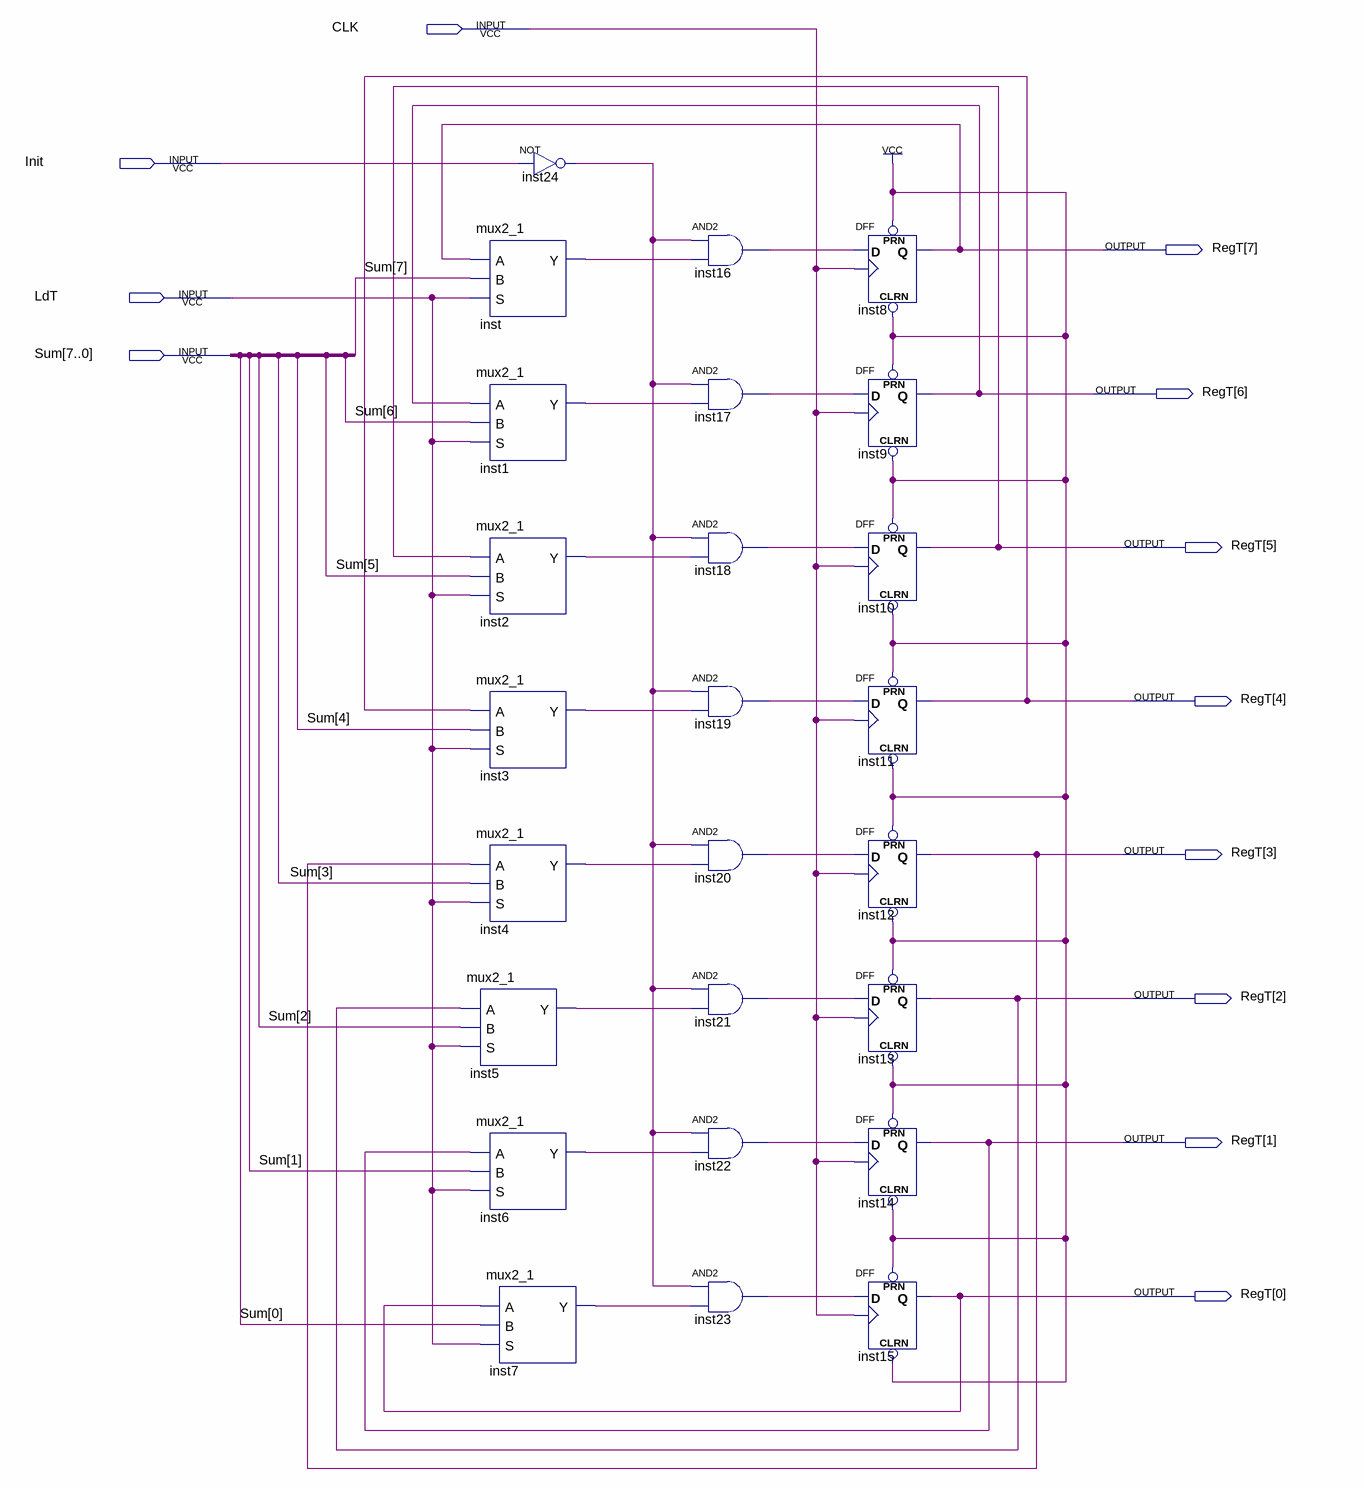
[diagram p0: schematic sheet]
// Quartus schematic RegT.bdf as structural Verilog: 25 symbols, 12 pins
module RegT (
  input  CLK,
  input  Init,
  input  LdT,
  input  [7:0] Sum,
  output [7:0] RegT
);

  wire inst1_y, inst2_y, inst3_y, inst4_y, inst5_y, inst6_y, inst7_y, inst16_out, inst17_out, inst18_out,
       inst19_out, inst20_out, inst21_out, inst22_out, inst23_out, inst24_out, inst_y;

  mux2_1 inst (.A(RegT[7]), .B(Sum[7]), .S(LdT), .Y(inst_y));
  mux2_1 inst1 (.A(RegT[6]), .B(Sum[6]), .S(LdT), .Y(inst1_y));
  mux2_1 inst2 (.A(RegT[5]), .B(Sum[5]), .S(LdT), .Y(inst2_y));
  mux2_1 inst3 (.A(RegT[4]), .B(Sum[4]), .S(LdT), .Y(inst3_y));
  mux2_1 inst4 (.A(RegT[3]), .B(Sum[3]), .S(LdT), .Y(inst4_y));
  mux2_1 inst5 (.A(RegT[2]), .B(Sum[2]), .S(LdT), .Y(inst5_y));
  mux2_1 inst6 (.A(RegT[1]), .B(Sum[1]), .S(LdT), .Y(inst6_y));
  mux2_1 inst7 (.A(RegT[0]), .B(Sum[0]), .S(LdT), .Y(inst7_y));
  not inst24 (inst24_out, Init);
  and inst16 (inst16_out, inst24_out, inst_y);
  and inst17 (inst17_out, inst24_out, inst1_y);
  and inst18 (inst18_out, inst24_out, inst2_y);
  and inst19 (inst19_out, inst24_out, inst3_y);
  and inst20 (inst20_out, inst24_out, inst4_y);
  and inst21 (inst21_out, inst24_out, inst5_y);
  and inst22 (inst22_out, inst24_out, inst6_y);
  and inst23 (inst23_out, inst24_out, inst7_y);
  DFF inst8 (.CLRN(1'b1), .CLK(CLK), .D(inst16_out), .PRN(1'b1), .Q(RegT[7]));
  DFF inst9 (.CLRN(1'b1), .CLK(CLK), .D(inst17_out), .PRN(1'b1), .Q(RegT[6]));
  DFF inst10 (.CLRN(1'b1), .CLK(CLK), .D(inst18_out), .PRN(1'b1), .Q(RegT[5]));
  DFF inst11 (.CLRN(1'b1), .CLK(CLK), .D(inst19_out), .PRN(1'b1), .Q(RegT[4]));
  DFF inst12 (.CLRN(1'b1), .CLK(CLK), .D(inst20_out), .PRN(1'b1), .Q(RegT[3]));
  DFF inst13 (.CLRN(1'b1), .CLK(CLK), .D(inst21_out), .PRN(1'b1), .Q(RegT[2]));
  DFF inst14 (.CLRN(1'b1), .CLK(CLK), .D(inst22_out), .PRN(1'b1), .Q(RegT[1]));
  DFF inst15 (.CLRN(1'b1), .CLK(CLK), .D(inst23_out), .PRN(1'b1), .Q(RegT[0]));
endmodule
